# Altium schematic sheet LDOs.SchDoc
size A; SheetNumber: 3; SheetTotal: 9
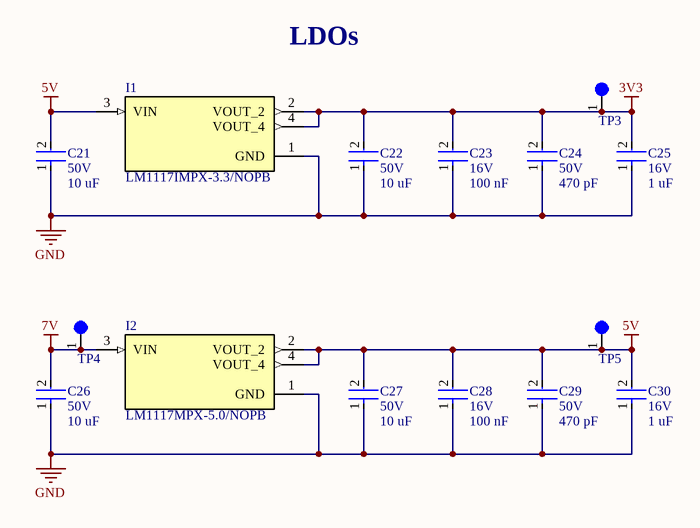
[diagram p0: LDOs.SchDoc]

## Parts
C21  Voltage Rating: 50V  Capacitance: 10 uF  [CAP-1210]  (hidden comment: CL32B106KMVNNWE)
C22  Voltage Rating: 50V  Capacitance: 10 uF  [CAP-1210]  (hidden comment: CL32B106KMVNNWE)
C23  Voltage Rating: 16V  Capacitance: 100 nF  [CAP-0805]  (hidden comment: CL21B104KBCNNNC)
C24  Voltage Rating: 50V  Capacitance: 470 pF  [CAP-0805]  (hidden comment: C0805C471K5RACTU)
C25  Voltage Rating: 16V  Capacitance: 1 uF  [CAP-0805]  (hidden comment: CC0805JKX7R9BB105)
C26  Voltage Rating: 50V  Capacitance: 10 uF  [CAP-1210]  (hidden comment: CL32B106KMVNNWE)
C27  Voltage Rating: 50V  Capacitance: 10 uF  [CAP-1210]  (hidden comment: CL32B106KMVNNWE)
C28  Voltage Rating: 16V  Capacitance: 100 nF  [CAP-0805]  (hidden comment: CL21B104KBCNNNC)
C29  Voltage Rating: 50V  Capacitance: 470 pF  [CAP-0805]  (hidden comment: C0805C471K5RACTU)
C30  Voltage Rating: 16V  Capacitance: 1 uF  [CAP-0805]  (hidden comment: CC0805JKX7R9BB105)
I1  LM1117IMPX-3.3/NOPB  [IC-SOT-223-4]
I2  LM1117MPX-5.0/NOPB  [IC-SOT-223-4]
TP3  5003  [TEST-POINT-0001]  (value not drawn)
TP4  5003  [TEST-POINT-0001]  (value not drawn)
TP5  5003  [TEST-POINT-0001]  (value not drawn)

## Nets
3V3: C22.2 C23.2 C24.2 C25.2 I1.2(VOUT_2) I1.4(VOUT_4) TP3.1
5V: C21.2 C27.2 C28.2 C29.2 C30.2 I1.3(VIN) I2.2(VOUT_2) I2.4(VOUT_4) TP5.1
7V: C26.2 I2.3(VIN) TP4.1
GND: C21.1 C22.1 C23.1 C24.1 C25.1 C26.1 C27.1 C28.1 C29.1 C30.1 I1.1(GND) I2.1(GND)

## Notes on the sheet
- LDOs

## Library data of the parts
C21 C22 C26 C27 = CAP 1210
C23-C25 C28-C30 = CAP 0805
I1 = IC_LDO_3V3_0001: IC REG LIN 3.3V 800MA SOT223-4; ComponentLink1Description: New link; ComponentLink1URL: https://www.ti.com/lit/ds/symlink/lm1117.pdf?HQS=dis-dk-null-digikeymode-dsf-pf-null-wwe&ts=1721700739746
I2 = IC_LDO_5V_0001: IC REG LINEAR 5V 800MA SOT223-4; ComponentLink1Description: Datasheet; ComponentLink1URL: https://www.ti.com/lit/ds/symlink/lm1117.pdf?HQS=dis-dk-null-digikeymode-dsf-pf-null-wwe&ts=1721700739746
TP3-TP5 = TEST-POINT-0001: Oranange PC Test Point, Miniature Phoisphor Bronze Silver Plating Through Hole Mounting Type